# Altium schematic sheet Sheet1.SchDoc
size A4; SheetNumber: 1; SheetTotal: 1
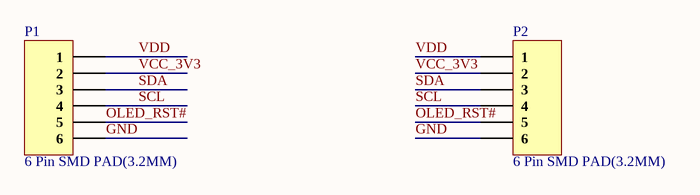
[diagram p0: Sheet1.SchDoc]

## Parts
P1  6 Pin SMD PAD(3.2MM)  [6 Pin SMD PAD(3.2mm)]
P2  6 Pin SMD PAD(3.2MM)  [6 Pin SMD PAD(3.2mm)]

## Nets
GND: P1.6 P2.6
OLED_RST#: P1.5 P2.5
SCL: P1.4 P2.4
SDA: P1.3 P2.3
VCC_3V3: P1.2 P2.2
VDD: P1.1 P2.1

## Library data of the parts
P1 P2 = 6 Pin SMD PAD(3.2MM): Ribbon Wire Connecting PADs, Length 5mm.